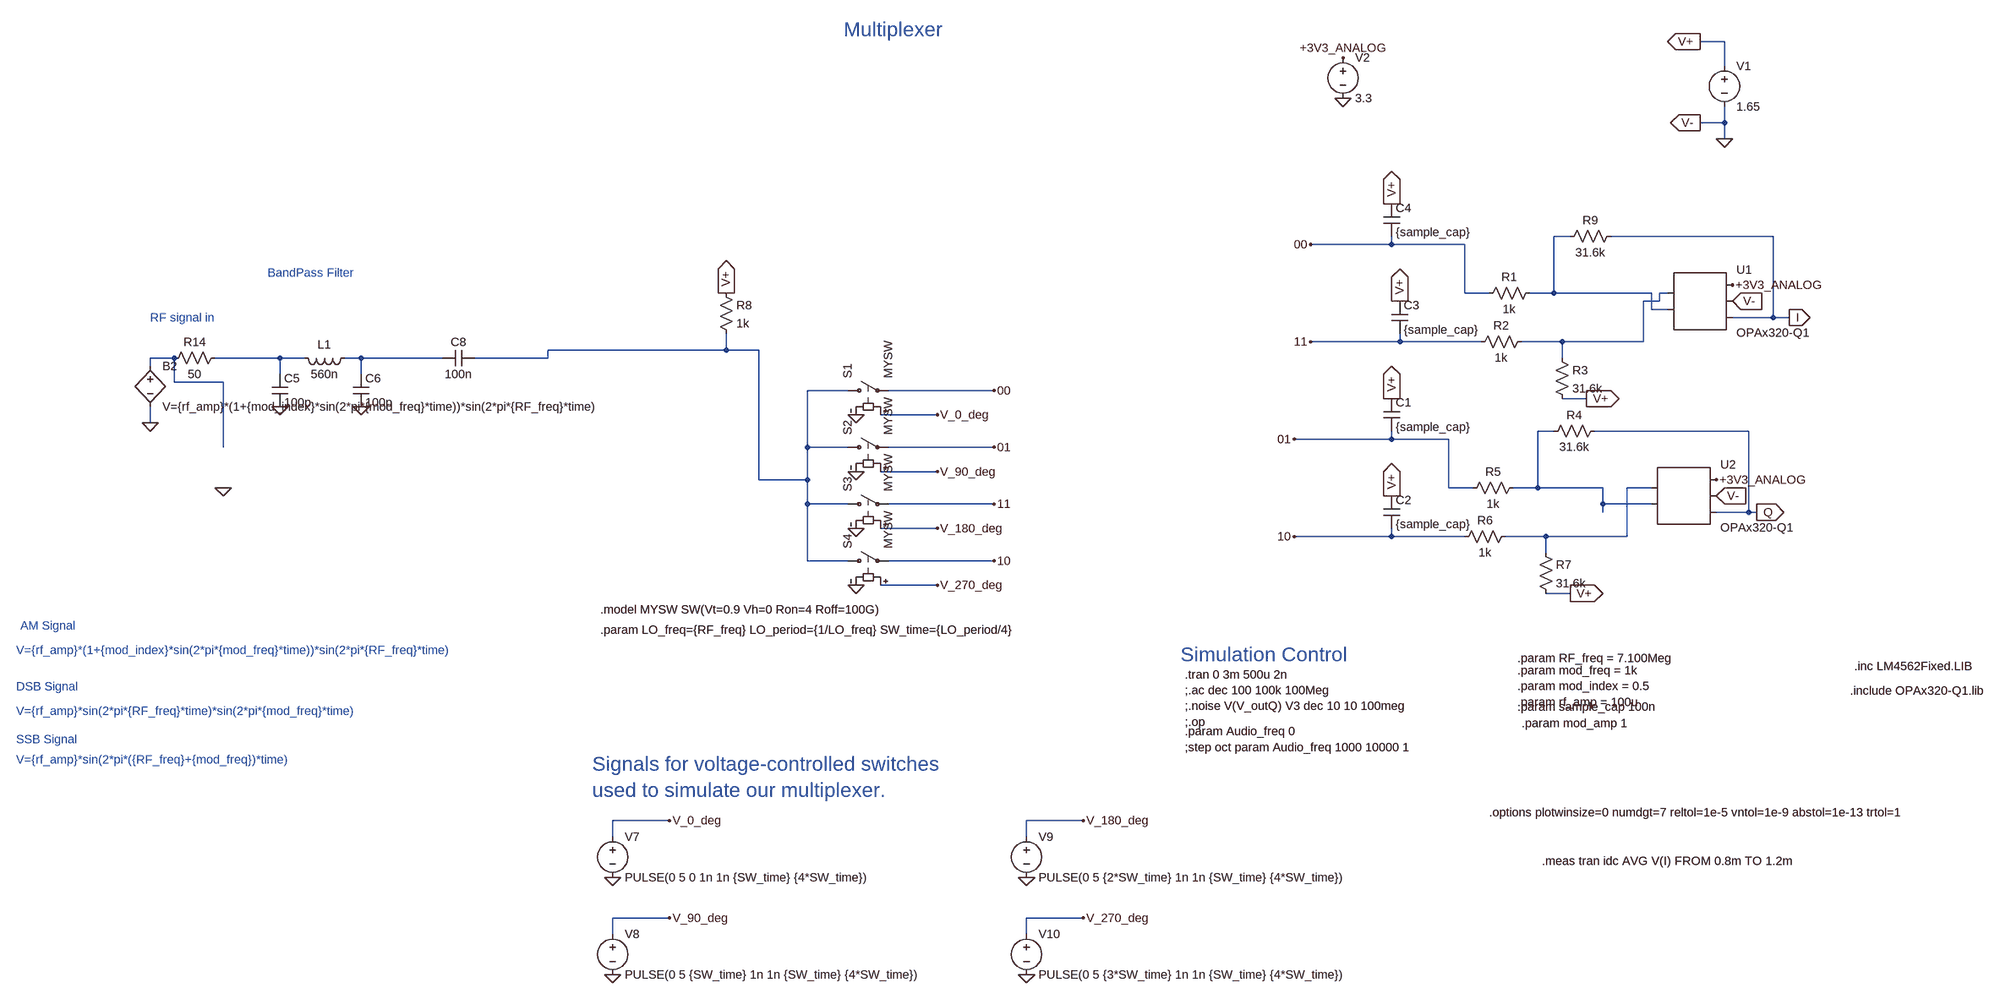
[diagram p0: schematic Mixer and amp model.asc]
Mixer and amp model.asc, the LTspice schematic file:
Version 4
SHEET 1 1280 680
WIRE -336 -1360 -384 -1360
WIRE -336 -1312 -336 -1360
WIRE -336 -1200 -336 -1232
WIRE -336 -1200 -384 -1200
WIRE -336 -1168 -336 -1200
WIRE -640 -976 -672 -976
WIRE -240 -976 -560 -976
WIRE -992 -960 -992 -976
WIRE -992 -960 -1152 -960
WIRE -848 -960 -992 -960
WIRE -848 -864 -848 -960
WIRE -800 -864 -848 -864
WIRE -672 -864 -672 -976
WIRE -672 -864 -720 -864
WIRE -480 -864 -672 -864
WIRE -448 -864 -464 -864
WIRE -464 -848 -464 -864
WIRE -464 -848 -496 -848
WIRE -480 -832 -480 -864
WIRE -448 -832 -480 -832
WIRE -240 -816 -240 -976
WIRE -240 -816 -320 -816
WIRE -208 -816 -240 -816
WIRE -976 -768 -976 -784
WIRE -976 -768 -1152 -768
WIRE -816 -768 -976 -768
WIRE -656 -768 -736 -768
WIRE -496 -768 -496 -848
WIRE -496 -768 -656 -768
WIRE -2304 -752 -2304 -784
WIRE -2304 -752 -2656 -752
WIRE -2240 -752 -2304 -752
WIRE -3392 -736 -3440 -736
WIRE -3184 -736 -3312 -736
WIRE -3136 -736 -3184 -736
WIRE -3024 -736 -3056 -736
WIRE -2864 -736 -3024 -736
WIRE -2656 -736 -2656 -752
WIRE -2656 -736 -2800 -736
WIRE -656 -736 -656 -768
WIRE -3440 -720 -3440 -736
WIRE -3184 -704 -3184 -736
WIRE -3024 -704 -3024 -736
WIRE -3392 -688 -3392 -736
WIRE -3296 -688 -3392 -688
WIRE -2064 -672 -2144 -672
WIRE -1776 -672 -1984 -672
WIRE -608 -656 -656 -656
WIRE -1888 -624 -2000 -624
WIRE -3440 -608 -3440 -640
WIRE -672 -592 -704 -592
WIRE -288 -592 -592 -592
WIRE -992 -576 -992 -592
WIRE -992 -576 -1184 -576
WIRE -880 -576 -992 -576
WIRE -3296 -560 -3296 -688
WIRE -2144 -560 -2144 -672
WIRE -2064 -560 -2144 -560
WIRE -1776 -560 -1984 -560
WIRE -1888 -512 -2000 -512
WIRE -2240 -496 -2240 -752
WIRE -2144 -496 -2144 -560
WIRE -2144 -496 -2240 -496
WIRE -880 -480 -880 -576
WIRE -832 -480 -880 -480
WIRE -704 -480 -704 -592
WIRE -704 -480 -752 -480
WIRE -576 -480 -704 -480
WIRE -480 -480 -528 -480
WIRE -2144 -448 -2144 -496
WIRE -2064 -448 -2144 -448
WIRE -1776 -448 -1984 -448
WIRE -576 -448 -576 -480
WIRE -480 -448 -576 -448
WIRE -576 -432 -576 -448
WIRE -288 -432 -288 -592
WIRE -288 -432 -352 -432
WIRE -272 -432 -288 -432
WIRE -1888 -400 -2000 -400
WIRE -992 -384 -992 -400
WIRE -992 -384 -1184 -384
WIRE -848 -384 -992 -384
WIRE -688 -384 -768 -384
WIRE -528 -384 -528 -480
WIRE -528 -384 -688 -384
WIRE -688 -352 -688 -384
WIRE -2144 -336 -2144 -448
WIRE -2064 -336 -2144 -336
WIRE -1776 -336 -1984 -336
WIRE -1888 -288 -2000 -288
WIRE -640 -272 -688 -272
WIRE -2416 176 -2528 176
WIRE -1600 176 -1712 176
WIRE -2528 208 -2528 176
WIRE -1712 208 -1712 176
WIRE -2416 368 -2528 368
WIRE -1600 368 -1712 368
WIRE -2528 400 -2528 368
WIRE -1712 400 -1712 368
FLAG -2048 -624 0
FLAG -2048 -512 0
FLAG -2048 -400 0
FLAG -2048 -288 0
FLAG -1888 -624 V_0_deg
FLAG -1888 -512 V_90_deg
FLAG -1888 -400 V_180_deg
FLAG -1888 -288 V_270_deg
FLAG -2528 288 0
FLAG -2416 176 V_0_deg
FLAG -2528 480 0
FLAG -2416 368 V_90_deg
FLAG -1712 288 0
FLAG -1600 176 V_180_deg
FLAG -1712 480 0
FLAG -1600 368 V_270_deg
FLAG -1776 -672 00
FLAG -1776 -448 11
FLAG -1776 -560 01
FLAG -1776 -336 10
FLAG -1152 -768 11
FLAG -1152 -960 00
FLAG -336 -1168 0
FLAG -384 -1360 V+
IOPIN -384 -1360 Out
FLAG -384 -1200 V-
IOPIN -384 -1200 Out
FLAG -208 -816 I
IOPIN -208 -816 Out
FLAG -3440 -608 0
FLAG -608 -656 V+
IOPIN -608 -656 Out
FLAG -1184 -384 10
FLAG -1184 -576 01
FLAG -352 -464 V-
IOPIN -352 -464 In
FLAG -640 -272 V+
IOPIN -640 -272 Out
FLAG -272 -432 Q
IOPIN -272 -432 Out
FLAG -992 -1040 V+
IOPIN -992 -1040 Out
FLAG -976 -848 V+
IOPIN -976 -848 Out
FLAG -992 -656 V+
IOPIN -992 -656 Out
FLAG -992 -464 V+
IOPIN -992 -464 Out
FLAG -2304 -864 V+
IOPIN -2304 -864 Out
FLAG -3184 -640 0
FLAG -3024 -640 0
FLAG -3296 -480 0
FLAG -1088 -1248 0
FLAG -1088 -1328 +3V3_ANALOG
FLAG -352 -496 +3V3_ANALOG
FLAG -320 -880 +3V3_ANALOG
FLAG -320 -848 V-
IOPIN -320 -848 In
SYMBOL sw -2080 -672 R270
SYMATTR InstName S1
SYMATTR Value MYSW
SYMBOL sw -2080 -560 R270
SYMATTR InstName S2
SYMATTR Value MYSW
SYMBOL sw -2080 -448 R270
SYMATTR InstName S3
SYMATTR Value MYSW
SYMBOL sw -2080 -336 R270
SYMATTR InstName S4
SYMATTR Value MYSW
SYMBOL voltage -2528 192 R0
WINDOW 123 0 0 Left 0
WINDOW 39 0 0 Left 0
SYMATTR InstName V7
SYMATTR Value PULSE(0 5 0 1n 1n {SW_time} {4*SW_time})
SYMBOL voltage -2528 384 R0
WINDOW 123 0 0 Left 0
WINDOW 39 0 0 Left 0
SYMATTR InstName V8
SYMATTR Value PULSE(0 5 {SW_time} 1n 1n {SW_time} {4*SW_time})
SYMBOL voltage -1712 192 R0
WINDOW 123 0 0 Left 0
WINDOW 39 0 0 Left 0
SYMATTR InstName V9
SYMATTR Value PULSE(0 5 {2*SW_time} 1n 1n {SW_time} {4*SW_time})
SYMBOL voltage -1712 384 R0
WINDOW 123 0 0 Left 0
WINDOW 39 0 0 Left 0
SYMATTR InstName V10
SYMATTR Value PULSE(0 5 {3*SW_time} 1n 1n {SW_time} {4*SW_time})
SYMBOL res -544 -992 R90
WINDOW 0 0 56 VBottom 2
WINDOW 3 32 56 VTop 2
SYMATTR InstName R9
SYMATTR Value 31.6k
SYMBOL voltage -336 -1328 R0
SYMATTR InstName V1
SYMATTR Value 1.65
SYMBOL ind -3040 -752 R90
WINDOW 0 5 56 VBottom 2
WINDOW 3 32 56 VTop 2
SYMATTR InstName L1
SYMATTR Value 560n
SYMBOL Res -816 -848 R270
WINDOW 0 32 56 VTop 2
WINDOW 3 0 56 VBottom 2
SYMATTR InstName R1
SYMATTR Value 1k
SYMBOL Res -832 -752 R270
WINDOW 0 32 56 VTop 2
WINDOW 3 0 56 VBottom 2
SYMATTR InstName R2
SYMATTR Value 1k
SYMBOL Res -672 -752 R0
SYMATTR InstName R3
SYMATTR Value 31.6k
SYMBOL res -576 -608 R90
WINDOW 0 0 56 VBottom 2
WINDOW 3 32 56 VTop 2
SYMATTR InstName R4
SYMATTR Value 31.6k
SYMBOL Res -848 -464 R270
WINDOW 0 32 56 VTop 2
WINDOW 3 0 56 VBottom 2
SYMATTR InstName R5
SYMATTR Value 1k
SYMBOL Res -864 -368 R270
WINDOW 0 32 56 VTop 2
WINDOW 3 0 56 VBottom 2
SYMATTR InstName R6
SYMATTR Value 1k
SYMBOL Res -704 -368 R0
SYMATTR InstName R7
SYMATTR Value 31.6k
SYMBOL Cap -1008 -656 R0
SYMATTR InstName C1
SYMATTR Value {sample_cap}
SYMBOL Cap -1008 -464 R0
SYMATTR InstName C2
SYMATTR Value {sample_cap}
SYMBOL Cap -992 -848 R0
SYMATTR InstName C3
SYMATTR Value {sample_cap}
SYMBOL Cap -1008 -1040 R0
SYMATTR InstName C4
SYMATTR Value {sample_cap}
SYMBOL Res -2320 -880 R0
SYMATTR InstName R8
SYMATTR Value 1k
SYMBOL Cap -3200 -704 R0
SYMATTR InstName C5
SYMATTR Value 100p
SYMBOL Cap -3040 -704 R0
SYMATTR InstName C6
SYMATTR Value 100p
SYMBOL AutoGenerated/OPAx320-Q1 -416 -464 R0
SYMATTR InstName U2
SYMBOL Res -3408 -720 R270
WINDOW 0 32 56 VTop 2
WINDOW 3 0 56 VBottom 2
SYMATTR InstName R14
SYMATTR Value 50
SYMBOL bv -3440 -736 R0
SYMATTR InstName B2
SYMATTR Value V={rf_amp}*(1+{mod_index}*sin(2*pi*{mod_freq}*time))*sin(2*pi*{RF_freq}*time)
SYMBOL Cap -2800 -752 R90
WINDOW 0 0 32 VBottom 2
WINDOW 3 32 32 VTop 2
SYMATTR InstName C8
SYMATTR Value 100n
SYMBOL Voltage -1088 -1344 R0
SYMATTR InstName V2
SYMATTR Value 3.3
SYMBOL AutoGenerated/OPAx320-Q1 -384 -848 R0
SYMATTR InstName U1
TEXT -80 -128 Left 2 !.inc LM4562Fixed.LIB
TEXT -2552 -240 Left 2 !.model MYSW SW(Vt=0.9 Vh=0 Ron=4 Roff=100G)
TEXT -1400 -112 Left 2 !.tran 0 3m 500u 2n\n;.ac dec 100 100k 100Meg\n;.noise V(V_outQ) V3 dec 10 10 100meg\n;.op
TEXT -2552 -200 Left 2 !.param LO_freq={RF_freq} LO_period={1/LO_freq} SW_time={LO_period/4}
TEXT -2568 64 Left 4 ;Signals for voltage-controlled switches \nused to simulate our multiplexer.
TEXT -2072 -1384 Left 4 ;Multiplexer
TEXT -1408 -152 Left 4 ;Simulation Control
TEXT -1400 32 Left 2 !;step oct param Audio_freq 1000 10000 1
TEXT -1400 0 Left 2 !.param Audio_freq 0
TEXT -3440 -816 Left 2 ;RF signal in
TEXT -3208 -904 Left 2 ;BandPass Filter
TEXT -88 -80 Left 2 !.include OPAx320-Q1.lib
TEXT -744 -144 Left 2 !.param RF_freq = 7.100Meg
TEXT -744 -120 Left 2 !.param mod_freq = 1k\n.param mod_index = 0.5\n.param rf_amp = 100u
TEXT -696 256 Left 2 !.meas tran idc AVG V(I) FROM 0.8m TO 1.2m
TEXT -3704 -160 Left 2 ;V={rf_amp}*(1+{mod_index}*sin(2*pi*{mod_freq}*time))*sin(2*pi*{RF_freq}*time)
TEXT -744 -48 Left 2 !.param sample_cap 100n
TEXT -800 160 Left 2 !.options plotwinsize=0 numdgt=7 reltol=1e-5 vntol=1e-9 abstol=1e-13 trtol=1
TEXT -3696 -208 Left 2 ;AM Signal
TEXT -3704 -88 Left 2 ;DSB Signal
TEXT -3704 -40 Left 2 ;V={rf_amp}*sin(2*pi*{RF_freq}*time)*sin(2*pi*{mod_freq}*time)
TEXT -736 -16 Left 2 !.param mod_amp 1
TEXT -3704 16 Left 2 ;SSB Signal
TEXT -3704 56 Left 2 ;V={rf_amp}*sin(2*pi*({RF_freq}+{mod_freq})*time)

The netlist it stands for:
* Mixer and amp model.asc
S1 N003 00 V_0_deg 0 MYSW
S2 N003 01 V_90_deg 0 MYSW
S3 N003 11 V_180_deg 0 MYSW
S4 N003 10 V_270_deg 0 MYSW
V7 V_0_deg 0 PULSE(0 5 0 1n 1n {SW_time} {4*SW_time})
V8 V_90_deg 0 PULSE(0 5 {SW_time} 1n 1n {SW_time} {4*SW_time})
V9 V_180_deg 0 PULSE(0 5 {2*SW_time} 1n 1n {SW_time} {4*SW_time})
V10 V_270_deg 0 PULSE(0 5 {3*SW_time} 1n 1n {SW_time} {4*SW_time})
R9 I N001 31.6k
V1 V+ 0 1.65
L1 N006 N005 560n
R1 00 N001 1k
R2 11 N002 1k
R3 N002 V+ 31.6k
R4 Q N007 31.6k
R5 01 N007 1k
R6 10 N008 1k
R7 N008 V+ 31.6k
C1 V+ 01 {sample_cap}
C2 V+ 10 {sample_cap}
C3 V+ 11 {sample_cap}
C4 V+ 00 {sample_cap}
R8 V+ N003 1k
C5 N005 0 100p
C6 N006 0 100p
* U2: OPAx320-Q1 (symbol AutoGenerated/OPAx320-Q1 not available, pins judged from their places): pin1=N008 pin2=N007 pin3=+3V3_ANALOG pin4=0 pin5=Q
R14 N004 N005 50
B2 N004 0 V={rf_amp}*(1+{mod_index}*sin(2*pi*{mod_freq}*time))*sin(2*pi*{RF_freq}*time)
C8 N003 N006 100n
V2 +3V3_ANALOG 0 3.3
* U1: OPAx320-Q1 (symbol AutoGenerated/OPAx320-Q1 not available, pins judged from their places): pin1=N002 pin2=N001 pin3=+3V3_ANALOG pin4=0 pin5=I
.inc LM4562Fixed.LIB
.model MYSW SW(Vt=0.9 Vh=0 Ron=4 Roff=100G)
.tran 0 3m 500u 2n
;.ac dec 100 100k 100Meg
;.noise V(V_outQ) V3 dec 10 10 100meg
;.op
.param LO_freq={RF_freq} LO_period={1/LO_freq} SW_time={LO_period/4}
* Signals for voltage-controlled switches
* used to simulate our multiplexer.
* Multiplexer
* Simulation Control
;step oct param Audio_freq 1000 10000 1
.param Audio_freq 0
* RF signal in
* BandPass Filter
.include OPAx320-Q1.lib
.param RF_freq = 7.100Meg
.param mod_freq = 1k
.param mod_index = 0.5
.param rf_amp = 100u
.meas tran idc AVG V(I) FROM 0.8m TO 1.2m
* V={rf_amp}*(1+{mod_index}*sin(2*pi*{mod_freq}*time))*sin(2*pi*{RF_freq}*time)
.param sample_cap 100n
.options plotwinsize=0 numdgt=7 reltol=1e-5 vntol=1e-9 abstol=1e-13 trtol=1
* AM Signal
* DSB Signal
* V={rf_amp}*sin(2*pi*{RF_freq}*time)*sin(2*pi*{mod_freq}*time)
.param mod_amp 1
* SSB Signal
* V={rf_amp}*sin(2*pi*({RF_freq}+{mod_freq})*time)
.backanno
.end